# Altium schematic sheet 07_J1_CONN.SchDoc
size 420 x 297 mm; SheetNumber: 7; SheetTotal: 8
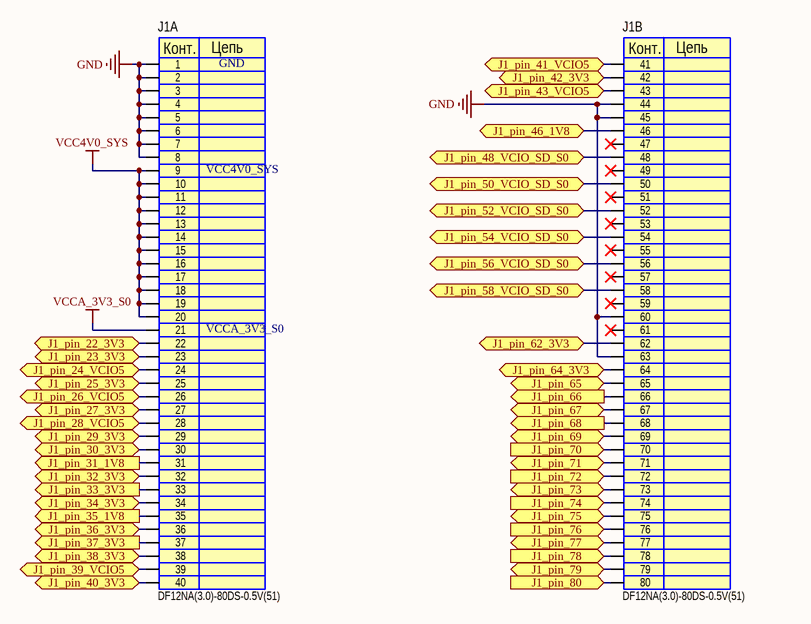
[diagram p0: 07_J1_CONN.SchDoc]

## Parts
J1  DF12NA(3.0)-80DS-0.5V(51)  [CONN_DF12NA3.0-80DS-0.5V51_HIR]  (parts A,B of 2)

## Ports
J1_pin_22_3V3 (bidir), J1_pin_23_3V3 (bidir), J1_pin_24_VCIO5 (bidir), J1_pin_25_3V3 (bidir), J1_pin_26_VCIO5 (bidir), J1_pin_27_3V3 (bidir), J1_pin_28_VCIO5 (bidir), J1_pin_29_3V3 (bidir), J1_pin_30_3V3 (bidir), J1_pin_31_1V8 (out), J1_pin_32_3V3 (bidir), J1_pin_33_3V3 (out), J1_pin_34_3V3 (bidir), J1_pin_35_1V8 (out), J1_pin_36_3V3 (bidir), J1_pin_37_3V3 (out), J1_pin_38_3V3 (bidir), J1_pin_39_VCIO5 (bidir), J1_pin_40_3V3 (bidir), J1_pin_41_VCIO5 (bidir), J1_pin_42_3V3 (bidir), J1_pin_43_VCIO5 (bidir), J1_pin_46_1V8 (bidir), J1_pin_48_VCIO_SD_S0 (bidir), J1_pin_50_VCIO_SD_S0 (bidir), J1_pin_52_VCIO_SD_S0 (bidir), J1_pin_54_VCIO_SD_S0 (bidir), J1_pin_56_VCIO_SD_S0 (bidir), J1_pin_58_VCIO_SD_S0 (bidir), J1_pin_62_3V3 (bidir), J1_pin_64_3V3 (bidir), J1_pin_65 (bidir), J1_pin_66 (out), J1_pin_67 (bidir), J1_pin_68 (out), J1_pin_69 (bidir), J1_pin_70 (in), J1_pin_71 (bidir), J1_pin_72 (in), J1_pin_73 (bidir), J1_pin_74 (in), J1_pin_75 (bidir), J1_pin_76 (in), J1_pin_77 (bidir), J1_pin_78 (in), J1_pin_79 (bidir), J1_pin_80 (in)

## Nets
GND: J1.1 J1.2 J1.3 J1.4 J1.5 J1.6 J1.7 J1.8 J1.44 J1.45 J1.60 J1.63
VCC4V0_SYS: J1.9 J1.10 J1.11 J1.12 J1.13 J1.14 J1.15 J1.16 J1.17 J1.18 J1.19 J1.20
VCCA_3V3_S0: J1.21
J1_pin_22_3V3: J1.22 ; port J1_pin_22_3V3
J1_pin_23_3V3: J1.23 ; port J1_pin_23_3V3
J1_pin_24_VCIO5: J1.24 ; port J1_pin_24_VCIO5
J1_pin_25_3V3: J1.25 ; port J1_pin_25_3V3
J1_pin_26_VCIO5: J1.26 ; port J1_pin_26_VCIO5
J1_pin_27_3V3: J1.27 ; port J1_pin_27_3V3
J1_pin_28_VCIO5: J1.28 ; port J1_pin_28_VCIO5
J1_pin_29_3V3: J1.29 ; port J1_pin_29_3V3
J1_pin_30_3V3: J1.30 ; port J1_pin_30_3V3
J1_pin_31_1V8: J1.31 ; port J1_pin_31_1V8
J1_pin_32_3V3: J1.32 ; port J1_pin_32_3V3
J1_pin_33_3V3: J1.33 ; port J1_pin_33_3V3
J1_pin_34_3V3: J1.34 ; port J1_pin_34_3V3
J1_pin_35_1V8: J1.35 ; port J1_pin_35_1V8
J1_pin_36_3V3: J1.36 ; port J1_pin_36_3V3
J1_pin_37_3V3: J1.37 ; port J1_pin_37_3V3
J1_pin_38_3V3: J1.38 ; port J1_pin_38_3V3
J1_pin_39_VCIO5: J1.39 ; port J1_pin_39_VCIO5
J1_pin_40_3V3: J1.40 ; port J1_pin_40_3V3
J1_pin_41_VCIO5: J1.41 ; port J1_pin_41_VCIO5
J1_pin_42_3V3: J1.42 ; port J1_pin_42_3V3
J1_pin_43_VCIO5: J1.43 ; port J1_pin_43_VCIO5
J1_pin_46_1V8: J1.46 ; port J1_pin_46_1V8
J1_pin_48_VCIO_SD_S0: J1.48 ; port J1_pin_48_VCIO_SD_S0
J1_pin_50_VCIO_SD_S0: J1.50 ; port J1_pin_50_VCIO_SD_S0
J1_pin_52_VCIO_SD_S0: J1.52 ; port J1_pin_52_VCIO_SD_S0
J1_pin_54_VCIO_SD_S0: J1.54 ; port J1_pin_54_VCIO_SD_S0
J1_pin_56_VCIO_SD_S0: J1.56 ; port J1_pin_56_VCIO_SD_S0
J1_pin_58_VCIO_SD_S0: J1.58 ; port J1_pin_58_VCIO_SD_S0
J1_pin_62_3V3: J1.62 ; port J1_pin_62_3V3
J1_pin_64_3V3: J1.64 ; port J1_pin_64_3V3
J1_pin_65: J1.65 ; port J1_pin_65
J1_pin_66: J1.66 ; port J1_pin_66
J1_pin_67: J1.67 ; port J1_pin_67
J1_pin_68: J1.68 ; port J1_pin_68
J1_pin_69: J1.69 ; port J1_pin_69
J1_pin_70: J1.70 ; port J1_pin_70
J1_pin_71: J1.71 ; port J1_pin_71
J1_pin_72: J1.72 ; port J1_pin_72
J1_pin_73: J1.73 ; port J1_pin_73
J1_pin_74: J1.74 ; port J1_pin_74
J1_pin_75: J1.75 ; port J1_pin_75
J1_pin_76: J1.76 ; port J1_pin_76
J1_pin_77: J1.77 ; port J1_pin_77
J1_pin_78: J1.78 ; port J1_pin_78
J1_pin_79: J1.79 ; port J1_pin_79
J1_pin_80: J1.80 ; port J1_pin_80

Not connected (* = marked no-connect by the designer): J1 47* 49* 51* 53* 55* 57* 59* 61*

## Notes on the sheet
- GND
- (near J1) VCC4V0_SYS
- (near J1) VCCA_3V3_S0
- THIS DOCUMENT AND THE DATA DISCLOSED HEREIN OR
- HEREWITH IS THE PROPERTY OF ALTIUM LIMITED AND MAY
- DWG NO:
- REVISION
- REV:
- DESCRIPTION
- DATE
- APPROVED
- BE FREELY DISTRIBUTED IN WHOLE. NO RIGHTS ARE
- RESERVED OR EXPRESS OR IMPLIED WARANTEE GIVEN.
- ENG:
- APPROVALS
- PROJECT
- DSN:
- CHK:
- REFERENCE DOCUMENTS
- PROJECT REVISION:
- TITLE
- DOCUMENT REVISION:
- DESIGN ITEM:
- BOM:
- FAB DWG:
- PCB DWG:
- ASSY DWG:
- SCALE:
- A3
- SIZE
- CAGE CODE
- FILE NAME
- DWG NO.
- SHEET
- OF
- REV
- (in symbol DF12NA(3.0)-80DS-0.5V(51), part A) Конт.; Цепь
- (in symbol DF12NA(3.0)-80DS-0.5V(51), part B) Конт.; Цепь

## Library data of the parts
J1 = DF12NA(3.0)-80DS-0.5V(51): 0.5mm Pitch SMT Board-to-Board Connector; Manufacturer: Hirose; Row: 2; Positions: 80; Male/Female: F; ComponentLink1Description: Link; ComponentLink2Description: LocalLink; ComponentLink2URL: C:\Users\Public\Documents\Altium\Datasheet\Connectors\DF12NA(3.0)-80DS-0.5V(51).pdf; Type: Board-to-Board; Temperature: -40...+105°C; PartNumber: DF12NA(3.0)-80DS-0.5V(51)